# Altium schematic sheet CONNECTORS.SchDoc
size A4; SheetNumber: 12; SheetTotal: 12
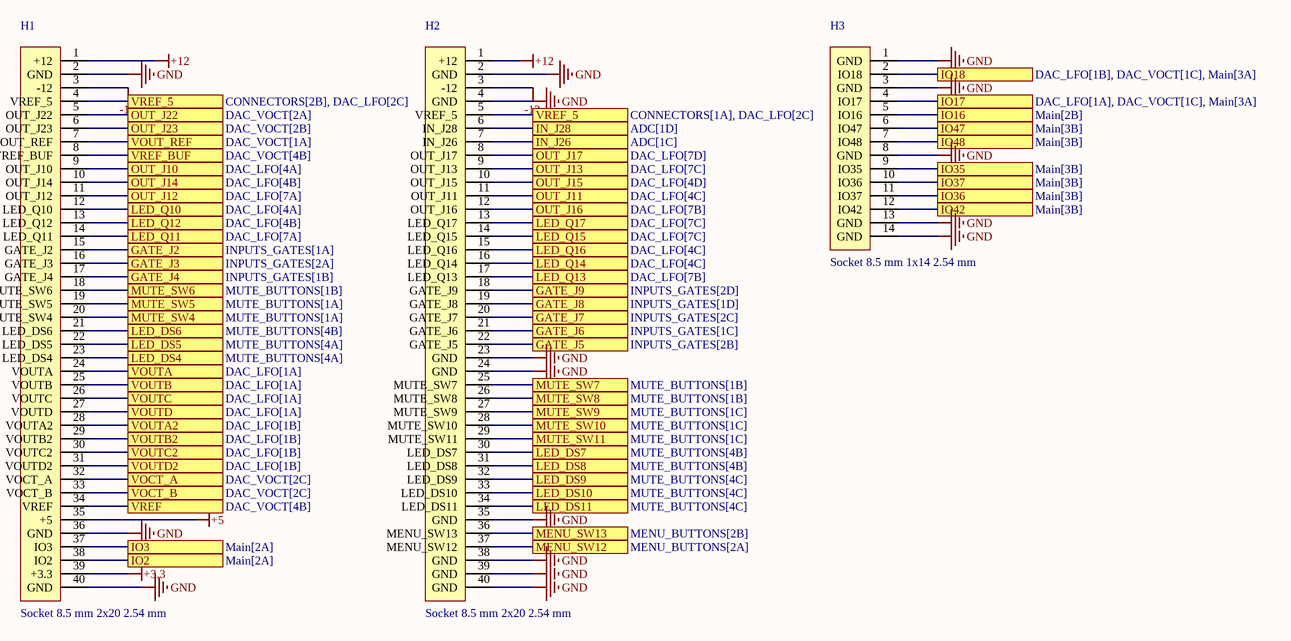
[diagram p0: CONNECTORS.SchDoc]

## Parts
H1  Socket 8.5 mm 2x20 2.54 mm  [HDR_2x20_P2.54_S]
H2  Socket 8.5 mm 2x20 2.54 mm  [HDR_2x20_P2.54_S]
H3  Socket 8.5 mm 1x14 2.54 mm  [HDR_1x14_P2.54]

## Ports
GATE_J2 (see INPUTS_GATES[1A]), GATE_J3 (see INPUTS_GATES[2A]), GATE_J4 (see INPUTS_GATES[1B]), GATE_J5 (see INPUTS_GATES[2B]), GATE_J6 (see INPUTS_GATES[1C]), GATE_J7 (see INPUTS_GATES[2C]), GATE_J8 (see INPUTS_GATES[1D]), GATE_J9 (see INPUTS_GATES[2D]), IN_J26 (see ADC[1C]), IN_J28 (see ADC[1D]), IO2 (see Main[2A]), IO3 (see Main[2A]), IO16 (see Main[2B]), IO17 (see DAC_LFO[1A], DAC_VOCT[1C], Main[3A]), IO18 (see DAC_LFO[1B], DAC_VOCT[1C], Main[3A]), IO35 (see Main[3B]), IO36 (see Main[3B]), IO37 (see Main[3B]), IO42 (see Main[3B]), IO47 (see Main[3B]), IO48 (see Main[3B]), LED_DS4 (see MUTE_BUTTONS[4A]), LED_DS5 (see MUTE_BUTTONS[4A]), LED_DS6 (see MUTE_BUTTONS[4B]), LED_DS7 (see MUTE_BUTTONS[4B]), LED_DS8 (see MUTE_BUTTONS[4B]), LED_DS9 (see MUTE_BUTTONS[4C]), LED_DS10 (see MUTE_BUTTONS[4C]), LED_DS11 (see MUTE_BUTTONS[4C]), LED_Q10 (see DAC_LFO[4A]), LED_Q11 (see DAC_LFO[7A]), LED_Q12 (see DAC_LFO[4B]), LED_Q13 (see DAC_LFO[7B]), LED_Q14 (see DAC_LFO[4C]), LED_Q15 (see DAC_LFO[7C]), LED_Q16 (see DAC_LFO[4C]), LED_Q17 (see DAC_LFO[7C]), MENU_SW12 (see MENU_BUTTONS[2A]), MENU_SW13 (see MENU_BUTTONS[2B]), MUTE_SW4 (see MUTE_BUTTONS[1A]), MUTE_SW5 (see MUTE_BUTTONS[1A]), MUTE_SW6 (see MUTE_BUTTONS[1B]), MUTE_SW7 (see MUTE_BUTTONS[1B]), MUTE_SW8 (see MUTE_BUTTONS[1B]), MUTE_SW9 (see MUTE_BUTTONS[1C]), MUTE_SW10 (see MUTE_BUTTONS[1C]), MUTE_SW11 (see MUTE_BUTTONS[1C]), OUT_J10 (see DAC_LFO[4A]), OUT_J11 (see DAC_LFO[4C]), OUT_J12 (see DAC_LFO[7A]), OUT_J13 (see DAC_LFO[7C]), OUT_J14 (see DAC_LFO[4B]), OUT_J15 (see DAC_LFO[4D]), OUT_J16 (see DAC_LFO[7B]), OUT_J17 (see DAC_LFO[7D]), OUT_J22 (see DAC_VOCT[2A]), OUT_J23 (see DAC_VOCT[2B]), VOCT_A (see DAC_VOCT[2C]), VOCT_B (see DAC_VOCT[2C]), VOUT_REF (see DAC_VOCT[1A]), VOUTA2 (see DAC_LFO[1B]), VOUTA (see DAC_LFO[1A]), VOUTB2 (see DAC_LFO[1B]), VOUTB (see DAC_LFO[1A]), VOUTC2 (see DAC_LFO[1B]), VOUTC (see DAC_LFO[1A]), VOUTD2 (see DAC_LFO[1B]), VOUTD (see DAC_LFO[1A]), VREF (see DAC_VOCT[4B]), VREF_5 (see CONNECTORS[1A], DAC_LFO[2C]), VREF_5 (see CONNECTORS[2B], DAC_LFO[2C]), VREF_BUF (see DAC_VOCT[4B])

## Nets
+3.3: H1.39(+3.3)
+5: H1.35(+5)
+12: H1.1(+12) H2.1(+12)
-12: H1.3(-12) H2.3(-12)
GND: H1.2(GND) H1.36(GND) H1.40(GND) H2.2(GND) H2.4(GND) H2.23(GND) H2.24(GND) H2.35(GND) H2.38(GND) H2.39(GND) H2.40(GND) H3.1(GND) H3.3(GND) H3.8(GND) H3.13(GND) H3.14(GND)
GATE_J2: H1.15(GATE_J2) ; port GATE_J2
GATE_J3: H1.16(GATE_J3) ; port GATE_J3
GATE_J4: H1.17(GATE_J4) ; port GATE_J4
GATE_J5: H2.22(GATE_J5) ; port GATE_J5
GATE_J6: H2.21(GATE_J6) ; port GATE_J6
GATE_J7: H2.20(GATE_J7) ; port GATE_J7
GATE_J8: H2.19(GATE_J8) ; port GATE_J8
GATE_J9: H2.18(GATE_J9) ; port GATE_J9
IN_J26: H2.7(IN_J26) ; port IN_J26
IN_J28: H2.6(IN_J28) ; port IN_J28
IO2: H1.38(IO2) ; port IO2
IO3: H1.37(IO3) ; port IO3
IO16: H3.5(IO16) ; port IO16
IO17: H3.4(IO17) ; port IO17
IO18: H3.2(IO18) ; port IO18
IO35: H3.9(IO35) ; port IO35
IO36: H3.11(IO37) ; port IO36
IO37: H3.10(IO36) ; port IO37
IO42: H3.12(IO42) ; port IO42
IO47: H3.6(IO47) ; port IO47
IO48: H3.7(IO48) ; port IO48
LED_DS4: H1.23(LED_DS4) ; port LED_DS4
LED_DS5: H1.22(LED_DS5) ; port LED_DS5
LED_DS6: H1.21(LED_DS6) ; port LED_DS6
LED_DS7: H2.30(LED_DS7) ; port LED_DS7
LED_DS8: H2.31(LED_DS8) ; port LED_DS8
LED_DS9: H2.32(LED_DS9) ; port LED_DS9
LED_DS10: H2.33(LED_DS10) ; port LED_DS10
LED_DS11: H2.34(LED_DS11) ; port LED_DS11
LED_Q10: H1.12(LED_Q10) ; port LED_Q10
LED_Q11: H1.14(LED_Q11) ; port LED_Q11
LED_Q12: H1.13(LED_Q12) ; port LED_Q12
LED_Q13: H2.17(LED_Q13) ; port LED_Q13
LED_Q14: H2.16(LED_Q14) ; port LED_Q14
LED_Q15: H2.14(LED_Q15) ; port LED_Q15
LED_Q16: H2.15(LED_Q16) ; port LED_Q16
LED_Q17: H2.13(LED_Q17) ; port LED_Q17
MENU_SW12: H2.37(MENU_SW12) ; port MENU_SW12
MENU_SW13: H2.36(MENU_SW13) ; port MENU_SW13
MUTE_SW4: H1.20(MUTE_SW4) ; port MUTE_SW4
MUTE_SW5: H1.19(MUTE_SW5) ; port MUTE_SW5
MUTE_SW6: H1.18(MUTE_SW6) ; port MUTE_SW6
MUTE_SW7: H2.25(MUTE_SW7) ; port MUTE_SW7
MUTE_SW8: H2.26(MUTE_SW8) ; port MUTE_SW8
MUTE_SW9: H2.27(MUTE_SW9) ; port MUTE_SW9
MUTE_SW10: H2.28(MUTE_SW10) ; port MUTE_SW10
MUTE_SW11: H2.29(MUTE_SW11) ; port MUTE_SW11
OUT_J10: H1.9(OUT_J10) ; port OUT_J10
OUT_J11: H2.11(OUT_J11) ; port OUT_J11
OUT_J12: H1.11(OUT_J12) ; port OUT_J12
OUT_J13: H2.9(OUT_J13) ; port OUT_J13
OUT_J14: H1.10(OUT_J14) ; port OUT_J14
OUT_J15: H2.10(OUT_J15) ; port OUT_J15
OUT_J16: H2.12(OUT_J16) ; port OUT_J16
OUT_J17: H2.8(OUT_J17) ; port OUT_J17
OUT_J22: H1.5(OUT_J22) ; port OUT_J22
OUT_J23: H1.6(OUT_J23) ; port OUT_J23
VOCT_A: H1.32(VOCT_A) ; port VOCT_A
VOCT_B: H1.33(VOCT_B) ; port VOCT_B
VOUT_REF: H1.7(VOUT_REF) ; port VOUT_REF
VOUTA: H1.24(VOUTA) ; port VOUTA
VOUTA2: H1.28(VOUTA2) ; port VOUTA2
VOUTB: H1.25(VOUTB) ; port VOUTB
VOUTB2: H1.29(VOUTB2) ; port VOUTB2
VOUTC: H1.26(VOUTC) ; port VOUTC
VOUTC2: H1.30(VOUTC2) ; port VOUTC2
VOUTD: H1.27(VOUTD) ; port VOUTD
VOUTD2: H1.31(VOUTD2) ; port VOUTD2
VREF: H1.34(VREF) ; port VREF
VREF_5: H1.4(VREF_5) H2.5(VREF_5) ; port VREF_5
VREF_BUF: H1.8(VREF_BUF) ; port VREF_BUF

## Library data of the parts
H1 H2 = Header_2x20
H3 = Header_1x14